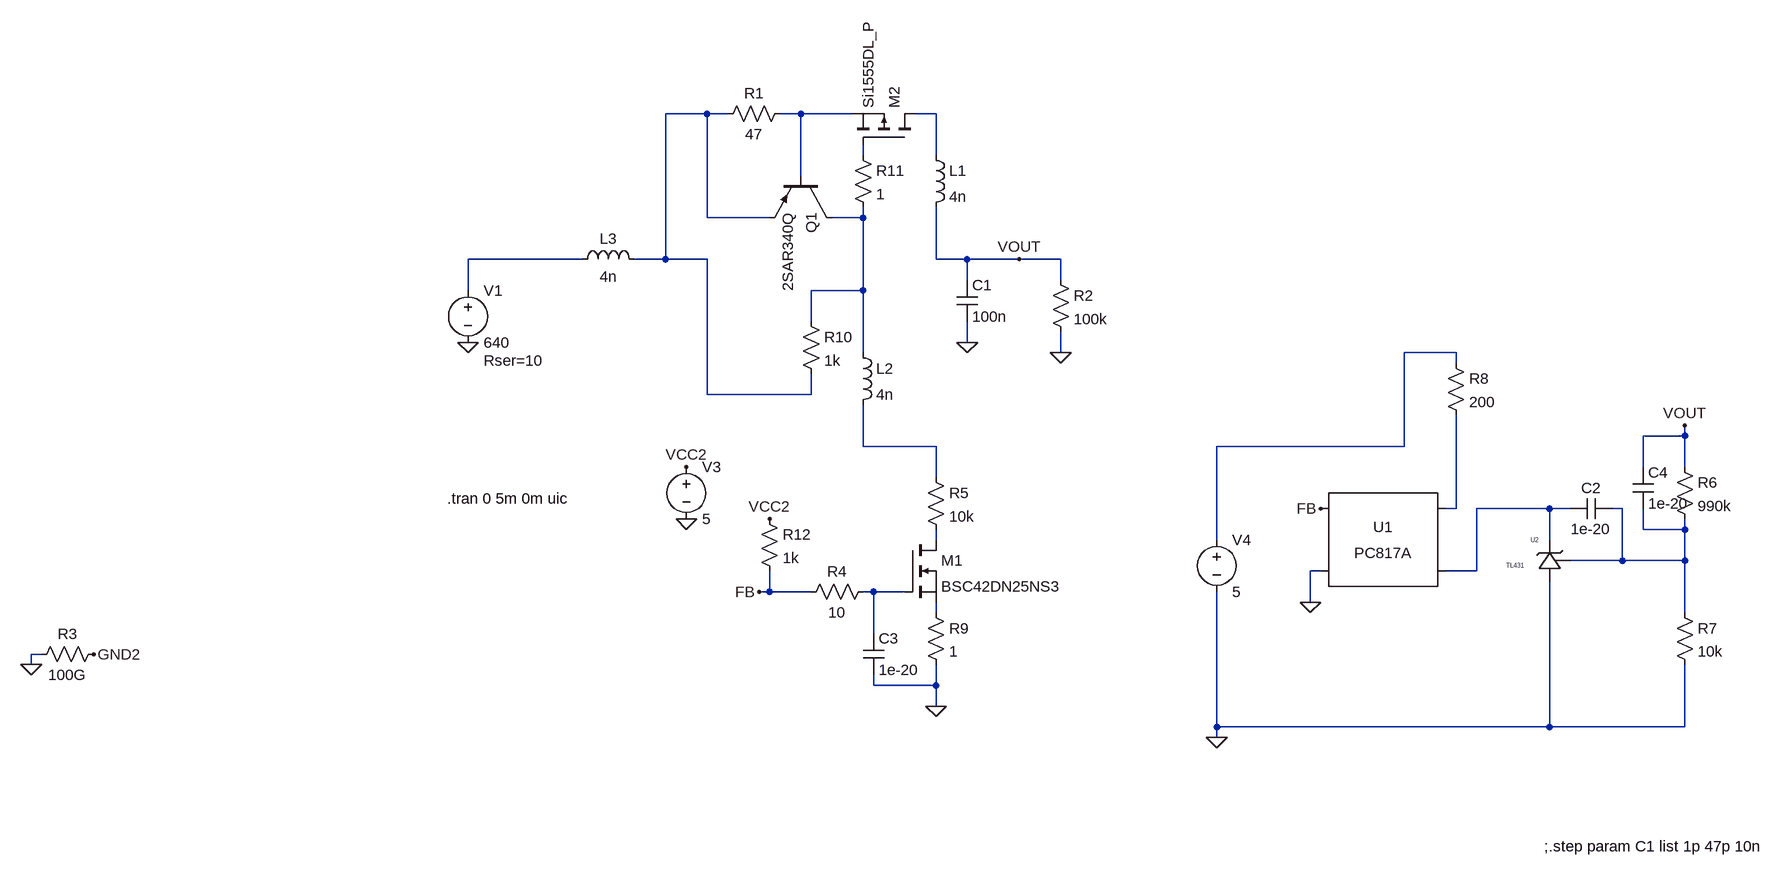
[diagram p0: schematic high_voltage_power_supply_pnp_tl431.asc]
high_voltage_power_supply_pnp_tl431.asc, the LTspice schematic file:
Version 4
SHEET 1 2548 1104
WIRE 416 -224 352 -224
WIRE 448 -224 416 -224
WIRE 560 -224 528 -224
WIRE 640 -224 560 -224
WIRE 768 -224 736 -224
WIRE 656 -160 656 -176
WIRE 768 -160 768 -224
WIRE 560 -128 560 -224
WIRE 416 -64 416 -224
WIRE 512 -64 416 -64
WIRE 656 -64 656 -80
WIRE 656 -64 608 -64
WIRE 224 0 48 0
WIRE 352 0 352 -224
WIRE 352 0 304 0
WIRE 416 0 352 0
WIRE 768 0 768 -80
WIRE 816 0 768 0
WIRE 896 0 816 0
WIRE 960 0 896 0
WIRE 816 32 816 0
WIRE 960 32 960 0
WIRE 48 48 48 0
WIRE 656 48 656 -64
WIRE 656 48 576 48
WIRE 576 96 576 48
WIRE 816 128 816 96
WIRE 656 144 656 48
WIRE 960 144 960 112
WIRE 1568 144 1488 144
WIRE 1568 160 1568 144
WIRE 416 208 416 0
WIRE 576 208 576 176
WIRE 576 208 416 208
WIRE 1920 272 1920 256
WIRE 1920 272 1856 272
WIRE 656 288 656 224
WIRE 768 288 656 288
WIRE 1488 288 1488 144
WIRE 1488 288 1200 288
WIRE 1856 320 1856 272
WIRE 1920 320 1920 272
WIRE 768 336 768 288
WIRE 1568 384 1568 240
WIRE 1568 384 1552 384
WIRE 1712 384 1600 384
WIRE 1744 384 1712 384
WIRE 1824 384 1808 384
WIRE 1856 416 1856 384
WIRE 1920 416 1920 400
WIRE 1920 416 1856 416
WIRE 768 432 768 416
WIRE 1200 432 1200 288
WIRE 1712 432 1712 384
WIRE 1824 464 1824 384
WIRE 1824 464 1744 464
WIRE 1920 464 1920 416
WIRE 1920 464 1824 464
WIRE 1360 480 1344 480
WIRE 1600 480 1600 384
WIRE 1600 480 1552 480
WIRE 512 512 512 480
WIRE 512 512 496 512
WIRE 576 512 512 512
WIRE 672 512 656 512
WIRE 720 512 672 512
WIRE 1344 528 1344 480
WIRE 768 544 768 528
WIRE 1920 544 1920 464
WIRE 672 576 672 512
WIRE -608 608 -624 608
WIRE -624 624 -624 608
WIRE 672 656 672 640
WIRE 768 656 768 624
WIRE 768 656 672 656
WIRE 768 688 768 656
WIRE 1200 720 1200 512
WIRE 1712 720 1712 496
WIRE 1712 720 1200 720
WIRE 1920 720 1920 624
WIRE 1920 720 1712 720
WIRE 1200 736 1200 720
FLAG 48 128 0
FLAG 816 128 0
FLAG 960 144 0
FLAG -624 624 0
FLAG -528 608 GND2
FLAG 896 0 VOUT
FLAG 1920 256 VOUT
FLAG 1200 736 0
FLAG 496 512 FB
FLAG 768 688 0
FLAG 1360 384 FB
FLAG 384 400 0
FLAG 384 320 VCC2
FLAG 1344 528 0
FLAG 512 400 VCC2
SYMBOL voltage 48 32 R0
WINDOW 123 0 0 Left 0
WINDOW 39 24 124 Left 2
SYMATTR SpiceLine Rser=10
SYMATTR InstName V1
SYMATTR Value 640
SYMBOL res 432 -208 R270
WINDOW 0 32 56 VTop 2
WINDOW 3 0 56 VBottom 2
SYMATTR InstName R1
SYMATTR Value 47
SYMBOL cap 800 32 R0
SYMATTR InstName C1
SYMATTR Value 100n
SYMATTR SpiceLine Rser=0.1
SYMBOL res 944 16 R0
SYMATTR InstName R2
SYMATTR Value 100k
SYMBOL res -512 592 R90
WINDOW 0 0 56 VBottom 2
WINDOW 3 32 56 VTop 2
SYMATTR InstName R3
SYMATTR Value 100G
SYMBOL res 560 528 R270
WINDOW 0 32 56 VTop 2
WINDOW 3 0 56 VBottom 2
SYMATTR InstName R4
SYMATTR Value 10
SYMBOL res 752 320 R0
SYMATTR InstName R5
SYMATTR Value 10k
SYMBOL voltage 1200 416 R0
WINDOW 123 0 0 Left 0
WINDOW 39 24 124 Left 2
SYMATTR InstName V4
SYMATTR Value 5
SYMBOL res 1904 304 R0
SYMATTR InstName R6
SYMATTR Value 990k
SYMBOL res 1904 528 R0
SYMATTR InstName R7
SYMATTR Value 10k
SYMBOL cap 1808 368 R90
WINDOW 0 0 32 VBottom 2
WINDOW 3 32 32 VTop 2
SYMATTR InstName C2
SYMATTR Value 1e-20
SYMBOL cap 656 576 R0
SYMATTR InstName C3
SYMATTR Value 1e-20
SYMBOL pnp 608 -128 R90
SYMATTR InstName Q1
SYMATTR Value 2SAR340Q
SYMBOL res 752 528 R0
SYMATTR InstName R9
SYMATTR Value 1
SYMBOL cap 1840 320 R0
SYMATTR InstName C4
SYMATTR Value 1e-20
SYMBOL res 640 -176 R0
SYMATTR InstName R11
SYMATTR Value 1
SYMBOL TL431 1728 432 M0
SYMATTR InstName U2
SYMBOL Optos\\PC817A 1456 432 M0
SYMATTR InstName U1
SYMBOL res 1552 144 R0
SYMATTR InstName R8
SYMATTR Value 200
SYMBOL voltage 384 304 R0
WINDOW 123 0 0 Left 0
WINDOW 39 0 0 Left 0
SYMATTR InstName V3
SYMATTR Value 5
SYMBOL res 496 384 R0
SYMATTR InstName R12
SYMATTR Value 1k
SYMBOL ind 752 -176 R0
SYMATTR InstName L1
SYMATTR Value 4n
SYMBOL ind 640 128 R0
SYMATTR InstName L2
SYMATTR Value 4n
SYMBOL nmos 720 432 R0
SYMATTR InstName M1
SYMATTR Value BSC42DN25NS3
SYMBOL ind 208 16 R270
WINDOW 0 32 56 VTop 2
WINDOW 3 5 56 VBottom 2
SYMATTR InstName L3
SYMATTR Value 4n
SYMBOL pmos 736 -176 M270
SYMATTR InstName M2
SYMATTR Value Si1555DL_P
SYMBOL res 560 80 R0
SYMATTR InstName R10
SYMATTR Value 1k
TEXT 16 368 Left 2 !.tran 0 5m 0m uic
TEXT 1704 904 Left 2 !;.step param C1 list 1p 47p 10n

The netlist it stands for:
* high_voltage_power_supply_pnp_tl431.asc
V1 N006 0 640 Rser=10
R1 N001 N002 47
C1 VOUT 0 100n Rser=0.1
R2 VOUT 0 100k
R3 GND2 0 100G
R4 FB N013 10
R5 N008 N012 10k
V4 N007 0 5
R6 VOUT N011 990k
R7 N011 0 10k
C2 N011 N010 1e-20
C3 N013 0 1e-20
Q1 N005 N002 N001 0 2SAR340Q
R9 N014 0 1
C4 VOUT N011 1e-20
R11 N004 N005 1
XU2 0 N010 N011 TL431  ; pins A K R
XU1 N009 N010 FB 0 PC817 Igain=1m
R8 N007 N009 200
V3 VCC2 0 5
R12 VCC2 FB 1k
L1 N003 VOUT 4n
L2 N005 N008 4n
M1 N012 N013 N014 N014 BSC42DN25NS3
L3 N006 N001 4n
M2 N003 N004 N002 N002 Si1555DL_P
R10 N005 N001 1k
.model NPN NPN
.model PNP PNP
.lib standard.bjt
.model NMOS NMOS
.model PMOS PMOS
.lib standard.mos
.tran 0 5m 0m uic
;.step param C1 list 1p 47p 10n
.lib TL431.lib
.lib PC817.sub
.backanno
.end